# Altium project GTV11-Board.PrjPcb (part 4 of 4)

## Sheet Heater_Sheet.SchDoc
size A4
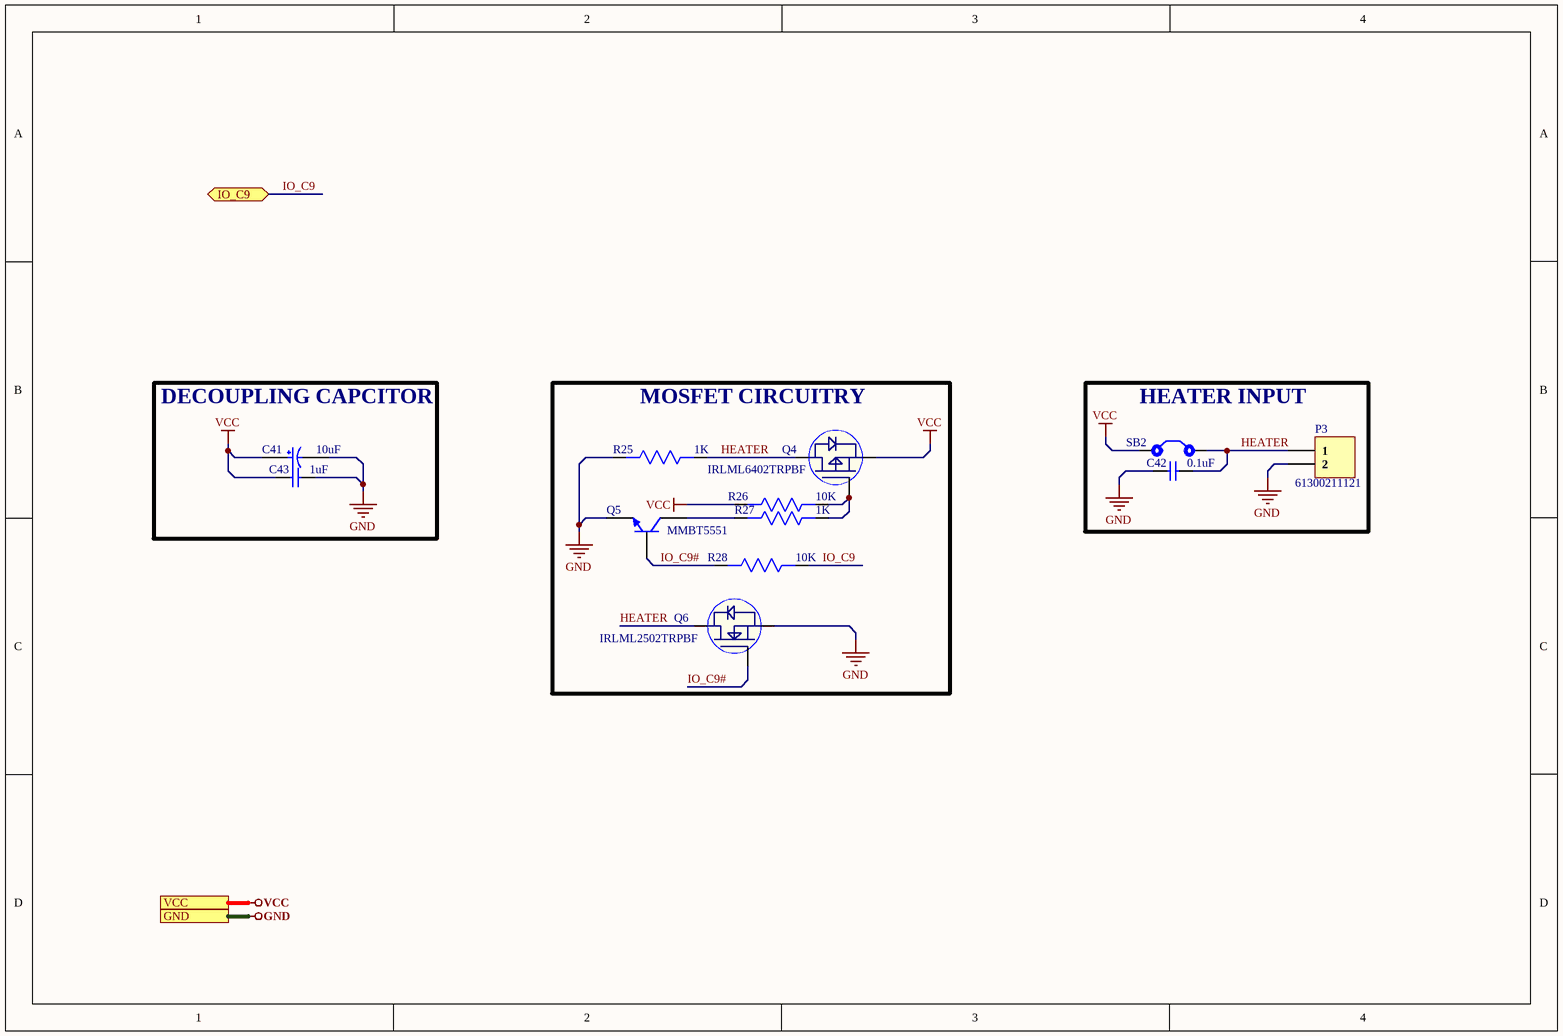
[diagram p10: Heater_Sheet.SchDoc]

### Parts
C41  10uF  [RVT1E100M0405.]
C42  0.1uF  [Cap0603]
C43  1uF  [Cap0603]
P3  61300211121  [HDR1X2]
Q4  IRLML6402TRPBF  [SOT-23]
Q5  MMBT5551  [SOT-23]
Q6  IRLML2502TRPBF  [SOT-23]
R25  1K  [RES-0603]
R26  10K  [RES-0603]
R27  1K  [RES-0603]
R28  10K  [RES-0603]
SB2  Solder Bridge  [Solder Bridge]  (value not drawn)

### Blocks framed on the sheet
DECOUPLING CAPCITOR: C41 C43
MOSFET CIRCUITRY: Q4-Q6 R25-R28
HEATER INPUT: C42 P3 SB2

### Ports
GND, IO_C9 (bidir), VCC

### Nets
GND: C41.2 C42.1 C43.2 P3.2 Q5.2(E) Q6.2(S) R25.2 ; port GND
VCC: C41.1 C43.1 Q4.2(S) R26.2 SB2.1 ; port VCC
HEATER: C42.2 P3.1 Q4.3(D) Q6.3(D) R25.1 SB2.2
IO_C9: R28.1 ; port IO_C9
IO_C9#: Q5.1(B) Q6.1(G) R28.2
NetQ4_1: Q4.1(G) R26.1 R27.1
NetQ5_3: Q5.3(C) R27.2

### Library data of the parts
C41 = RVT1E100M0405: CAP ALUM 10uF 25V SMD; Manufacturer: ROQANG; φD: 4mm; L: 5.4mm; Tolerance: ±20%; Operating Temperature: -45℃~+105℃; Rated Voltage: 25V; Capacitance: 10uF
C42 = CC0603ZRY5V9BB104: CAP CER 0.1UF 50V Y5V 0603; Manufacturer: Yageo; Capacitance: 100nF; Tolerance: 80%; Supplier 1: Digi-Key; Manufacturer Part Number: CC0603ZRY5V9BB104; Stock 1: 15000880; Pricing 1: 1=0.1, 10=0.075, 100=0.0334, 500=0.02386, 1000=0.01874 (USD); Mount: Surface Mount; Case/Package: 0603; Number of Pins: 2; Case Code (Metric): 1608; Case Code (Imperial): 0603; Min Operating Temperature: -30°C; Max Operating Temperature: 85°C; Dielectric: Y5V; Voltage Rating: 50V; Package Quantity: 1; Packaging: Tape and Reel; Voltage Rating (DC): 50V; Termination: SMD/SMT; Composition: Ceramic; Voltage: 50V; Length: 1.6mm; Height: 0.8mm; Width: 0.031inch; Thickness: 0.035inch; Depth: 0.8mm; Radiation Hardening: No; REACH SVHC: No SVHC; Lead Free: Lead Free; Halogen Free: Halogen Free; ComponentLink1URL: http://www.yageo.com/documents/recent/UPY-GPHC_Y5V_6.3V-to-50V_8.pdf?src-supplier=Digi-Key; ComponentLink1Description: http://www.yageo.com/documents/recent/UPY-GPHC_Y5V_6.3V-to-50V_8.pdf?src-supplier=Digi-Key; ComponentLink2URL: http://www.yageo.com/documents/recent/UPY-GPHC_Y5V_6.3V-to-50V_5.pdf?src-supplier=Avnet+Europe; ComponentLink2Description: http://www.yageo.com/documents/recent/UPY-GPHC_Y5V_6.3V-to-50V_5.pdf?src-supplier=Avnet+Europe; ComponentLink3URL: https://www.verical.com/server-webapp/html/getDatasheet?partID=403611&src-supplier=Verical; ComponentLink3Description: https://www.verical.com/server-webapp/html/getDatasheet?partID=403611&src-supplier=Verical; ComponentLink4URL: http://www.mouser.com/ds/2/447/Yageo_UPY-GP_NP0_16V-to-50V_9-358835.pdf?src-supplier=Mouser; ComponentLink4Description: http://www.mouser.com/ds/2/447/Yageo_UPY-GP_NP0_16V-to-50V_9-358835.pdf?src-supplier=Mouser; ComponentLink5URL: http://www.farnell.com/datasheets/1132289.pdf?src-supplier=Element14; ComponentLink5Description: http://www.farnell.com/datasheets/1132289.pdf?src-supplier=Element14; Supplier Part Number 1: 311-1343-1-ND
C43 = CC0603KRX5R8BB105: CAP CER 1UF 25V X5R 0603; Manufacturer: Yageo; Tolerance: 10%; Supplier 1: Digi-Key; Manufacturer Part Number: CC0603KRX5R8BB105; Stock 1: 1419041; Pricing 1: 1=0.1, 10=0.069, 100=0.0307, 500=0.0219, 1000=0.0172 (USD); Mount: Surface Mount; Case/Package: 0603; Number of Pins: 2; Case Code (Metric): 1608; Case Code (Imperial): 0603; Min Operating Temperature: -55°C; Max Operating Temperature: 85°C; Capacitance: 1uF; Dielectric: X5R; Package Quantity: 1; Voltage Rating: 25V; Packaging: Tape and Reel; Termination: SMD/SMT; Voltage Rating (DC): 25V; Length: 1.6mm; Height: 0.8mm; Width: 0.031inch; Thickness: 0.035inch; Depth: 0.8mm; Radiation Hardening: No; REACH SVHC: No SVHC; Lead Free: Lead Free; Halogen Free: Halogen Free; ComponentLink1URL: http://www.yageo.com/documents/recent/UPY-GPHC_X5R_4V-to-50V_25.pdf?src-supplier=Digi-Key; ComponentLink1Description: http://www.yageo.com/documents/recent/UPY-GPHC_X5R_4V-to-50V_25.pdf?src-supplier=Digi-Key; ComponentLink2URL: http://www.yageo.com/documents/recent/UPY-GPHC_X5R_4V-to-50V_12.pdf?src-supplier=Avnet+Europe; ComponentLink2Description: http://www.yageo.com/documents/recent/UPY-GPHC_X5R_4V-to-50V_12.pdf?src-supplier=Avnet+Europe; ComponentLink3URL: http://www.farnell.com/datasheets/1525783.pdf?src-supplier=Element14; ComponentLink3Description: http://www.farnell.com/datasheets/1525783.pdf?src-supplier=Element14; ComponentLink4URL: http://www.yageo.com/documents/recent/UPY-GPHC_X5R_4V-to-50V_12.pdf?src-supplier=Avnet; ComponentLink4Description: http://www.yageo.com/documents/recent/UPY-GPHC_X5R_4V-to-50V_12.pdf?src-supplier=Avnet; Supplier Part Number 1: 311-1445-6-ND
P3 = Header 1x2: CONN HEADER VERT 2POS 2.54MM; Manufacturer: Wurth Electronics; Current Rating: 3A; Voltage Rating: 250V; Number of Positions: 2; Gender: Male; Connector Type: Male Pin; Pitch: 0.1inch; Supplier 1: Digi-Key; Manufacturer Part Number: 61300211121; Stock 1: 219205; Pricing 1: 1=0.13, 10=0.106, 25=0.088, 50=0.074, 100=0.067, 1000=0.061 (USD); Mount: Through Hole; Contact Plating: Gold; Housing Material: PBT; Contact Material: Copper Alloy,Copper; Color: Black; Min Operating Temperature: -40°C; Max Operating Temperature: 125°C; Number of Rows: 1; Contact Gender: Male; Packaging: Bulk; Termination: Through Hole; Number of Contacts: 2; Contact Mating Length: 0.236inch; REACH SVHC: Unknown; Lead Free: Lead Free; ComponentLink1URL: http://www.mouser.com/ds/2/445/6130xx11121-538006.pdf?src-supplier=Mouser; ComponentLink1Description: http://www.mouser.com/ds/2/445/6130xx11121-538006.pdf?src-supplier=Mouser; Supplier Part Number 1: 732-5315-ND
Q4 = IRLML6402TRPBF: MOSFET P-CH 20V 3.7A SOT23; Manufacturer: International Rectifier; Rise Time: 48ns; Gate to Source Voltage (Vgs): 12V; Turn-On Delay Time: 350ns; Turn-Off Delay Time: 588ns; Fall Time: 381ns; Nominal Vgs: -550mV; Rds On Max: 65mR; Input Capacitance: 633pF; Max Power Dissipation: 1.3W; Number of Elements: 1; Dual Supply Voltage: -20V; Element Configuration: Single; Current Rating: -3.7A; Supplier 1: Newark; Manufacturer Part Number: IRLML6402TRPBF; RoHS: Yes; Category: MOSFETs; Mount: Surface Mount; Case/Package: SOT-23; Number of Pins: 3; Min Operating Temperature: -55°C; Max Operating Temperature: 150°C; Drain to Source Voltage (Vdss): 20V; Continuous Drain Current (ID): 3.7A; Package Quantity: 1; Packaging: Tape and Reel; Drain to Source Resistance: 65mR; Power Dissipation: 1.3W; Threshold Voltage: -550mV; Termination: SMD/SMT; Drain to Source Breakdown Voltage: -20V; Voltage Rating (DC): -20V; On-State Resistance: 65mR; Series: HEXFET®; Drain-source On Resistance-Max: 65mR; Length: 3.04mm; Width: 1.4mm; Height: 1.02mm; Radiation Hardening: No; Lead Free: Lead Free; RoHS Compliant: Yes; REACH SVHC: No SVHC; ComponentLink1URL: https://datasheet.ciiva.com/7799/13209-7799017.pdf?src-supplier=Element14; ComponentLink1Description: https://datasheet.ciiva.com/7799/13209-7799017.pdf?src-supplier=Element14; ComponentLink2URL: https://datasheet.ciiva.com/34302/1563729-34302500.pdf?src-supplier=Jameco; ComponentLink2Description: https://datasheet.ciiva.com/34302/1563729-34302500.pdf?src-supplier=Jameco; ComponentLink3URL: https://datasheet.ciiva.com/28515/irlml6402pbf-28515795.pdf?src-supplier=Element14; ComponentLink3Description: https://datasheet.ciiva.com/28515/irlml6402pbf-28515795.pdf?src-supplier=Element14; ComponentLink4URL: https://datasheet.ciiva.com/7333/irlml6402-7333200.pdf?src-supplier=Newark; ComponentLink4Description: https://datasheet.ciiva.com/7333/irlml6402-7333200.pdf?src-supplier=Newark; ComponentLink5URL: https://datasheet.ciiva.com/29326/162833-da-01-en-irlml-6402tr-29326798.pdf?src-supplier=Conrad; ComponentLink5Description: https://datasheet.ciiva.com/29326/162833-da-01-en-irlml-6402tr-29326798.pdf?src-supplier=Conrad; ComponentLink6URL: https://datasheet.ciiva.com/7799/13209-7799018.pdf?src-supplier=Element14; ComponentLink6Description: https://datasheet.ciiva.com/7799/13209-7799018.pdf?src-supplier=Element14; ComponentLink7URL: https://datasheet.ciiva.com/936/irlml6402pbf-936987.pdf?src-supplier=Digi-Key; ComponentLink7Description: https://datasheet.ciiva.com/936/irlml6402pbf-936987.pdf?src-supplier=Digi-Key; ComponentLink8URL: https://datasheet.ciiva.com/936/irlml6402pbf-936988.pdf?src-supplier=Digi-Key; ComponentLink8Description: https://datasheet.ciiva.com/936/irlml6402pbf-936988.pdf?src-supplier=Digi-Key; ComponentLink9URL: https://datasheet.ciiva.com/16311/irlml6402pbf-16311535.pdf?src-supplier=Future+Electronics; ComponentLink9Description: https://datasheet.ciiva.com/16311/irlml6402pbf-16311535.pdf?src-supplier=Future+Electronics; Supplier Part Number 1: 06X2796
Q5 = MMBT5551: TRANS NPN 160V 0.6A SOT-23; Manufacturer: ON Semiconductor; Manufacturer Part Number: MMBT5551LT1G; Max Power Dissipation: 225mW; Max Collector Current: 600mA; Collector Base Voltage (VCBO): 180V; Emitter Base Voltage (VEBO): 6V; Element Configuration: Single; hFE Min: 80; Power Dissipation: 300mW; Number of Elements: 1; Collector Emitter Saturation Voltage: 150mV; Collector-emitter Voltage-Max: 200mV; Supplier 1: Digi-Key; RoHS: Yes; Category: BJTs; Pricing 1: 1=0.22000, 10=0.17700, 100=0.09370, 500=0.06162, 1000=0.04190 (USD); Case/Package: SOT-23-3; Number of Pins: 3; Weight: 0.01lb; Contact Plating: Tin,Matte; Min Operating Temperature: -55°C; Max Operating Temperature: 150°C; Packaging: Tape and Reel; Collector Emitter Voltage (VCEO): 160V; Polarity: NPN; Package Quantity: 1; Collector Emitter Breakdown Voltage: 160V; Current Rating: 600mA; Voltage Rating (DC): 160V; Max Breakdown Voltage: 160V; Series: -; Length: 2.9mm; Width: 1.3mm; Height: 0.94mm; Radiation Hardening: No; Lead Free: Lead Free; REACH SVHC: No SVHC; RoHS Compliant: Yes; ComponentLink1URL: https://datasheet.ciiva.com/976/mmbt5550lt1-d-976512.pdf?src-supplier=Digi-Key; ComponentLink1Description: https://datasheet.ciiva.com/976/mmbt5550lt1-d-976512.pdf?src-supplier=Digi-Key; ComponentLink2URL: https://datasheet.ciiva.com/34303/2011387-34303825.pdf?src-supplier=Jameco; ComponentLink2Description: https://datasheet.ciiva.com/34303/2011387-34303825.pdf?src-supplier=Jameco; ComponentLink3URL: https://datasheet.ciiva.com/15139/getdatasheetpartid-92641-15139178.pdf?src-supplier=Verical; ComponentLink3Description: https://datasheet.ciiva.com/15139/getdatasheetpartid-92641-15139178.pdf?src-supplier=Verical; ComponentLink4URL: https://datasheet.ciiva.com/16984/0900766b8078eb1b-16984971.pdf?src-supplier=Allied+Electronics; ComponentLink4Description: https://datasheet.ciiva.com/16984/0900766b8078eb1b-16984971.pdf?src-supplier=Allied+Electronics; ComponentLink5URL: https://datasheet.ciiva.com/976/mmbt5550lt1-d-976513.pdf?src-supplier=Digi-Key; ComponentLink5Description: https://datasheet.ciiva.com/976/mmbt5550lt1-d-976513.pdf?src-supplier=Digi-Key; ComponentLink6URL: https://datasheet.ciiva.com/4722/mmbt5550lt1-d-111393-4722711.pdf?src-supplier=Mouser; ComponentLink6Description: https://datasheet.ciiva.com/4722/mmbt5550lt1-d-111393-4722711.pdf?src-supplier=Mouser; ComponentLink7URL: https://datasheet.ciiva.com/16478/mmbt5550lt1-d-16478568.pdf?src-supplier=Avnet+Asia; ComponentLink7Description: https://datasheet.ciiva.com/16478/mmbt5550lt1-d-16478568.pdf?src-supplier=Avnet+Asia; ComponentLink8URL: https://datasheet.ciiva.com/7972/mmbt5550lt1-d-7972073.pdf?src-supplier=Element14; ComponentLink8Description: https://datasheet.ciiva.com/7972/mmbt5550lt1-d-7972073.pdf?src-supplier=Element14; ComponentLink9URL: https://datasheet.ciiva.com/25997/mmbt5550lt1-d-25997449.pdf?src-supplier=Avnet+Europe; ComponentLink9Description: https://datasheet.ciiva.com/25997/mmbt5550lt1-d-25997449.pdf?src-supplier=Avnet+Europe; ComponentLink10URL: https://datasheet.ciiva.com/7972/mmbt5550lt1-d-7972075.pdf?src-supplier=Element14; ComponentLink10Description: https://datasheet.ciiva.com/7972/mmbt5550lt1-d-7972075.pdf?src-supplier=Element14; ComponentLink11URL: https://datasheet.ciiva.com/11197/mmbt5550lt1-d-11197404.pdf?src-supplier=Avnet; ComponentLink11Description: https://datasheet.ciiva.com/11197/mmbt5550lt1-d-11197404.pdf?src-supplier=Avnet; ComponentLink12URL: https://datasheet.ciiva.com/976/mmbt5550lt1-d-976511.pdf?src-supplier=Digi-Key; ComponentLink12Description: https://datasheet.ciiva.com/976/mmbt5550lt1-d-976511.pdf?src-supplier=Digi-Key; ComponentLink13URL: https://datasheet.ciiva.com/16342/mmbt5550lt1-d-16342687.pdf?src-supplier=Future+Electronics; ComponentLink13Description: https://datasheet.ciiva.com/16342/mmbt5550lt1-d-16342687.pdf?src-supplier=Future+Electronics; Supplier Part Number 1: MMBT5551LT1GOSDKR-ND
Q6 = IRLML2502TRPBF: MOSFET N-CH 20V 4.2A SOT23; Manufacturer: International Rectifier; Rise Time: 10ns; Max Power Dissipation: 1.25W; Gate to Source Voltage (Vgs): 12V; Turn-On Delay Time: 7.5ns; Turn-Off Delay Time: 54ns; Fall Time: 26ns; Threshold Voltage: 1.2V; Rds On Max: 45mR; Input Capacitance: 740pF; Number of Elements: 1; Element Configuration: Single; Supplier 1: Newark; Manufacturer Part Number: IRLML2502TRPBF; RoHS: Yes; Category: MOSFETs; Mount: Surface Mount; Case/Package: SOT-23; Number of Pins: 3; Min Operating Temperature: -55°C; Max Operating Temperature: 150°C; Continuous Drain Current (ID): 4.2A; Drain to Source Voltage (Vdss): 20V; Packaging: Tape and Reel; Package Quantity: 3000; Nominal Vgs: 1.2V; Dual Supply Voltage: 20V; Drain to Source Breakdown Voltage: 20V; Drain to Source Resistance: 45mR; Power Dissipation: 1.25W; Termination: SMD/SMT; Voltage Rating (DC): 20V; Current Rating: 4.2A; On-State Resistance: 45mR; Drain-source On Resistance-Max: 45mR; Length: 2.8mm; Width: 1.4mm; Height: 1.02mm; Radiation Hardening: No; REACH SVHC: No SVHC; Lead Free: Lead Free; ComponentLink1URL: https://datasheet.ciiva.com/36526/1563649-36526014.pdf?src-supplier=Jameco; ComponentLink1Description: https://datasheet.ciiva.com/36526/1563649-36526014.pdf?src-supplier=Jameco; ComponentLink2URL: https://datasheet.ciiva.com/16425/irlml2502pbf-16425943.pdf?src-supplier=Future+Electronics; ComponentLink2Description: https://datasheet.ciiva.com/16425/irlml2502pbf-16425943.pdf?src-supplier=Future+Electronics; ComponentLink3URL: https://datasheet.ciiva.com/6156/irlml2502-6156070.pdf?src-supplier=Farnell; ComponentLink3Description: https://datasheet.ciiva.com/6156/irlml2502-6156070.pdf?src-supplier=Farnell; ComponentLink4URL: https://datasheet.ciiva.com/7935/irlml2502-7935685.pdf?src-supplier=Element14; ComponentLink4Description: https://datasheet.ciiva.com/7935/irlml2502-7935685.pdf?src-supplier=Element14; Supplier Part Number 1: 11X6741
R25 R27 = RC0603FR-071KL: RES SMD 1K OHM 1% 1/10W 0603; Manufacturer: Yageo; Resistance: 1kR; Temperature Coefficient: 100ppm/°C; Power Rating: 100mW; Voltage Rating: 50V; ComponentLink1URL: https://www.verical.com/server-webapp/html/getDatasheet?partID=409289&src-supplier=Verical; ComponentLink1Description: https://www.verical.com/server-webapp/html/getDatasheet?partID=409289&src-supplier=Verical; Supplier 1: Digi-Key; Manufacturer Part Number: RC0603FR-071KL; Stock 1: 21472395; Pricing 1: 1=0.1, 10=0.023, 100=0.0094, 1000=0.0042, 2500=0.0037 (USD); Case/Package: 0603; Contact Plating: Tin,Matte; Case Code (Imperial): 0603; Case Code (Metric): 1608; Min Operating Temperature: -55°C; Max Operating Temperature: 155°C; Tolerance: 1%; Composition: Thick Film; Packaging: Tape and Reel; Termination: SMD/SMT; Military Standard: Not; Length: 1.6mm; Height: 0.45mm; Depth: 0.8mm; Radiation Hardening: No; REACH SVHC: No SVHC; Lead Free: Lead Free; ComponentLink2URL: http://documents.rs-components.com/techlib://itc_doclist_GB.htm?stockno=5048928&src-supplier=RSComponents; ComponentLink2Description: http://documents.rs-components.com/techlib://itc_doclist_GB.htm?stockno=5048928&src-supplier=RSComponents; ComponentLink3URL: http://www.yageo.com/documents/recent/PYu-RC0603_51_RoHS_L_4.pdf?src-supplier=Avnet+Europe; ComponentLink3Description: http://www.yageo.com/documents/recent/PYu-RC0603_51_RoHS_L_4.pdf?src-supplier=Avnet+Europe; ComponentLink4URL: http://www.farnell.com/datasheets/2167052.pdf?src-supplier=Element14; ComponentLink4Description: http://www.farnell.com/datasheets/2167052.pdf?src-supplier=Element14; ComponentLink5URL: http://www.farnell.com/datasheets/1868787.pdf?src-supplier=Element14; ComponentLink5Description: http://www.farnell.com/datasheets/1868787.pdf?src-supplier=Element14; ComponentLink6URL: http://www.yageo.com/documents/recent/PYu-RC_Group_51_RoHS_L_2.pdf?src-supplier=Avnet; ComponentLink6Description: http://www.yageo.com/documents/recent/PYu-RC_Group_51_RoHS_L_2.pdf?src-supplier=Avnet; ComponentLink7URL: https://www.verical.com/server-webapp/html/getDatasheet?partID=404327&src-supplier=Verical; ComponentLink7Description: https://www.verical.com/server-webapp/html/getDatasheet?partID=404327&src-supplier=Verical; ComponentLink8URL: http://www.farnell.com/datasheets/443971.pdf?src-supplier=Element14; ComponentLink8Description: http://www.farnell.com/datasheets/443971.pdf?src-supplier=Element14; Supplier Part Number 1: 311-1.00KHRDKR-ND
R26 R28 = AC0603JR-0710KL: RES SMD 10K OHM 5% 1/10W 0603; Manufacturer: Yageo; Voltage Rating: 50V; Resistance: 10kR; Power Rating: 100mW; Temperature Coefficient: 100ppm/°C; Supplier 1: Future Electronics; Manufacturer Part Number: AC0603JR-0710KL; RoHS: Yes; Category: Chip SMD Resistors; Stock 1: 1533000; Pricing 1: 5000=0.00540 (USD); Case/Package: 0603; Case Code (Imperial): 0603; Case Code (Metric): 1608; Size Code: 0603; Min Operating Temperature: -55°C; Max Operating Temperature: 155°C; Packaging: Tape and Reel; Tolerance: 5%; Package Quantity: 1; Resistor Type: Thick Film; Termination: SMD/SMT; Number of Terminations: 2; Max Power Dissipation: 100mW; Features: Moisture Resistant,Automotive AEC-Q200,Anti-Sulfur; Series: AC; Construction: Rectangular; Length: 0.063inch; Width: 0.031inch; Height: 0.022inch; Depth: 0.8mm; Military Standard: Not; Lead Free: Lead Free; RoHS Compliant: Yes; ComponentLink1URL: https://datasheet.ciiva.com/5562/pyu-ac-51-rohs-l-2-5562553.pdf?src-supplier=Mouser; ComponentLink1Description: https://datasheet.ciiva.com/5562/pyu-ac-51-rohs-l-2-5562553.pdf?src-supplier=Mouser; Supplier Part Number 1: 1029044
SB2 = Solder Bridge: Solder Bridge ON

## Sheet Temperature_Sensor_Section.SchDoc
size A4
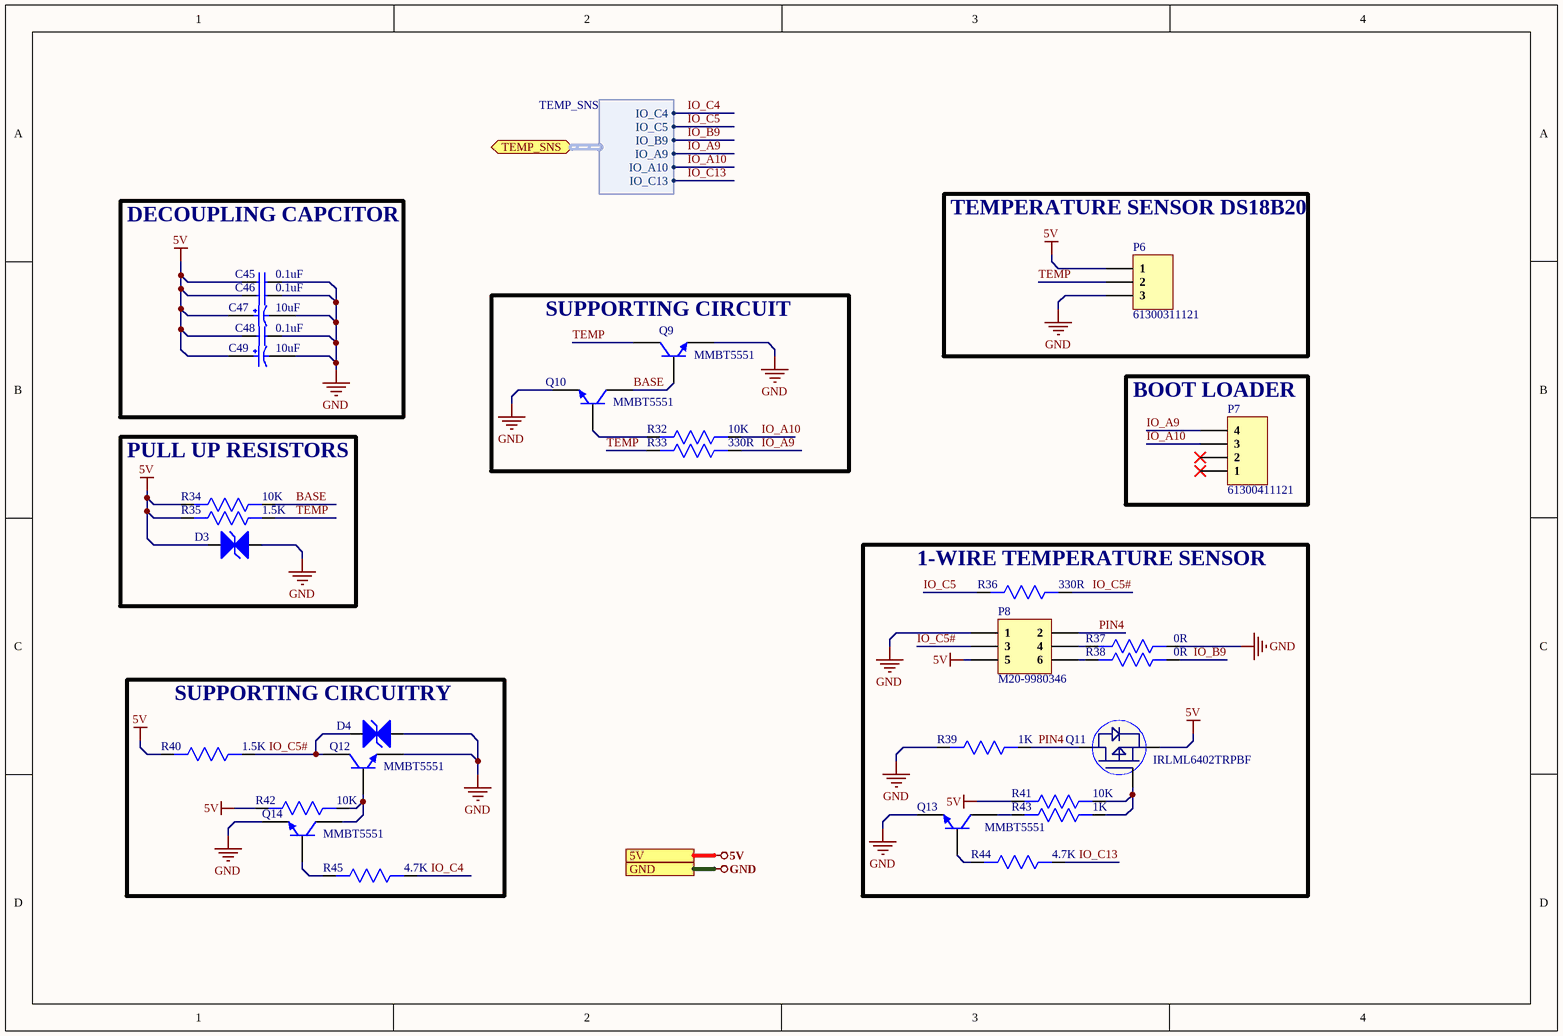
[diagram p11: Temperature_Sensor_Section.SchDoc]

### Parts
C45  0.1uF  [Cap0603]
C46  0.1uF  [Cap0603]
C47  10uF  [RVT1E100M0405.]
C48  0.1uF  [Cap0603]
C49  10uF  [RVT1E100M0405.]
D3  SMAJ5.0CA  [SMAJ5.0CA]  (value not drawn)
D4  SMAJ5.0CA  [SMAJ5.0CA]  (value not drawn)
P6  61300311121  [HDR1X3]
P7  61300411121  [HDR1X4]
P8  M20-9980346  [HDR2X3]
Q9  MMBT5551  [SOT-23]
Q10  MMBT5551  [SOT-23]
Q11  IRLML6402TRPBF  [SOT-23]
Q12  MMBT5551  [SOT-23]
Q13  MMBT5551  [SOT-23]
Q14  MMBT5551  [SOT-23]
R32  10K  [RES-0603]
R33  330R  [RES-0603]
R34  10K  [RES-0603]
R35  1.5K  [RES-0603]
R36  330R  [RES-0603]
R37  0R  [RES-0603]
R38  0R  [RES-0603]
R39  1K  [RES-0603]
R40  1.5K  [RES-0603]
R41  10K  [RES-0603]
R42  10K  [RES-0603]
R43  1K  [RES-0603]
R44  4.7K  [RES-0603]
R45  4.7K  [RES-0603]

### Blocks framed on the sheet
TEMPERATURE SENSOR DS18B20: P6
DECOUPLING CAPCITOR: C45-C49
SUPPORTING CIRCUIT: Q9 Q10 R32 R33
BOOT LOADER: P7
PULL UP RESISTORS: D3 R34 R35
1-WIRE TEMPERATURE SENSOR: P8 Q11 Q13 R36-R39 R41 R43 R44
SUPPORTING CIRCUITRY: D4 Q12 Q14 R40 R42 R45

### Ports
5V, GND, TEMP_SNS (bidir, harness TEMP_SNS)

### Harnesses
TEMP_SNS: IO_C4, IO_C5, IO_B9, IO_A9, IO_A10, IO_C13

### Nets
5V: C45.1 C46.1 C47.1 C48.1 C49.1 D3.2(A) P6.1 P8.5 Q11.2(S) R34.2 R35.2 R40.2 R41.2 R42.2 ; port 5V
GND: C45.2 C46.2 C47.2 C48.2 C49.2 D3.1(K) D4.1(K) P6.3 P8.1 Q9.2(E) Q10.2(E) Q12.2(E) Q13.2(E) Q14.2(E) R37.1 R39.2 ; port GND
BASE: Q9.1(B) Q10.3(C) R34.1
IO_A9: P7.4 R33.1 ; port TEMP_SNS.IO_A9
IO_A10: P7.3 R32.1 ; port TEMP_SNS.IO_A10
IO_B9: R38.1 ; port TEMP_SNS.IO_B9
IO_C4: R45.1 ; port TEMP_SNS.IO_C4
IO_C5: R36.2 ; port TEMP_SNS.IO_C5
IO_C5#: D4.2(A) P8.3 Q12.3(C) R36.1 R40.1
IO_C13: R44.1 ; port TEMP_SNS.IO_C13
PIN4: P8.2 Q11.3(D) R39.1
TEMP: P6.2 Q9.3(C) R33.2 R35.1
NetP8_4: P8.4 R37.2
NetP8_6: P8.6 R38.2
NetQ10_1: Q10.1(B) R32.2
NetQ11_1: Q11.1(G) R41.1 R43.1
NetQ12_1: Q12.1(B) Q14.3(C) R42.1
NetQ13_1: Q13.1(B) R44.2
NetQ13_3: Q13.3(C) R43.2
NetQ14_1: Q14.1(B) R45.2

Not connected (* = marked no-connect by the designer): P7 1* 2*

### Library data of the parts
C45 C46 C48 = CC0603ZRY5V9BB104: as C42 on sheet Heater_Sheet; Supplier 1: Digi-Key; Manufacturer Part Number: CC0603ZRY5V9BB104; Stock 1: 15000880; Pricing 1: 1=0.1, 10=0.075, 100=0.0334, 500=0.02386, 1000=0.01874 (USD); Mount: Surface Mount; Case/Package: 0603; Number of Pins: 2; Case Code (Metric): 1608; Case Code (Imperial): 0603; Min Operating Temperature: -30°C; Max Operating Temperature: 85°C; Dielectric: Y5V; Voltage Rating: 50V; Package Quantity: 1; Packaging: Tape and Reel; Voltage Rating (DC): 50V; Termination: SMD/SMT; Composition: Ceramic; Voltage: 50V; Length: 1.6mm; Height: 0.8mm; Width: 0.031inch; Thickness: 0.035inch; Depth: 0.8mm; Radiation Hardening: No; REACH SVHC: No SVHC; Lead Free: Lead Free; Halogen Free: Halogen Free; ComponentLink1URL: http://www.yageo.com/documents/recent/UPY-GPHC_Y5V_6.3V-to-50V_8.pdf?src-supplier=Digi-Key; ComponentLink1Description: http://www.yageo.com/documents/recent/UPY-GPHC_Y5V_6.3V-to-50V_8.pdf?src-supplier=Digi-Key; ComponentLink2URL: http://www.yageo.com/documents/recent/UPY-GPHC_Y5V_6.3V-to-50V_5.pdf?src-supplier=Avnet+Europe; ComponentLink2Description: http://www.yageo.com/documents/recent/UPY-GPHC_Y5V_6.3V-to-50V_5.pdf?src-supplier=Avnet+Europe; ComponentLink3URL: https://www.verical.com/server-webapp/html/getDatasheet?partID=403611&src-supplier=Verical; ComponentLink3Description: https://www.verical.com/server-webapp/html/getDatasheet?partID=403611&src-supplier=Verical; ComponentLink4URL: http://www.mouser.com/ds/2/447/Yageo_UPY-GP_NP0_16V-to-50V_9-358835.pdf?src-supplier=Mouser; ComponentLink4Description: http://www.mouser.com/ds/2/447/Yageo_UPY-GP_NP0_16V-to-50V_9-358835.pdf?src-supplier=Mouser; ComponentLink5URL: http://www.farnell.com/datasheets/1132289.pdf?src-supplier=Element14; ComponentLink5Description: http://www.farnell.com/datasheets/1132289.pdf?src-supplier=Element14; Supplier Part Number 1: 311-1343-1-ND
C47 C49 = RVT1E100M0405: as C41 on sheet Heater_Sheet; Operating Temperature: -45℃~+105℃; Rated Voltage: 25V; Capacitance: 10uF
D3 D4 = SMAJ5.0CA: 800uA 43.5A 9.2V 6.4V 5V 7V Bi-Directional SMA TVS ROHS; Manufacturer: Shandong Jingdao Microelectronics; ComponentLink1Description: LCSC; ComponentLink1URL: https://lcsc.com/product-detail/TVS_Shandong-Jingdao-Microelectronics-SMAJ5-0CA_C353441.html; Manufacturer Part Number: SMAJ5.0CA; Footprint: SMA
P6 = Header 1X3: CONN HEADER VERT 3POS 2.54MM; Manufacturer: Wurth Electronics; Number of Positions: 3; Gender: Male; Connector Type: Male Pin; Pitch: 0.1inch; Supplier 1: Digi-Key; Manufacturer Part Number: 61300311121; Stock 1: 81286; Pricing 1: 1=0.13, 10=0.106, 25=0.088, 50=0.074, 100=0.067, 1000=0.061 (USD); Mount: Through Hole; Contact Plating: Gold; Contact Material: Copper; Color: Black; Number of Rows: 1; Packaging: Bulk; Termination: Solder; Number of Contacts: 3; Contact Mating Length: 0.236inch; REACH SVHC: Unknown; Lead Free: Lead Free; ComponentLink1URL: http://www.farnell.com/cad/1737268.pdf?src-supplier=Element14; ComponentLink1Description: http://www.farnell.com/cad/1737268.pdf?src-supplier=Element14; ComponentLink2URL: https://katalog.we-online.de/em/datasheet/6130xx11121.pdf?src-supplier=Digi-Key; ComponentLink2Description: https://katalog.we-online.de/em/datasheet/6130xx11121.pdf?src-supplier=Digi-Key; Supplier Part Number 1: 732-5316-ND
P7 = Header 1x4: CONN HEADER VERT 4POS 2.54MM; Manufacturer: Wurth Electronics; Number of Positions: 4; Gender: Male; Connector Type: Male Pin; Pitch: 0.1inch; Supplier 1: Digi-Key; Manufacturer Part Number: 61300411121; Stock 1: 20544; Pricing 1: 1=0.18, 10=0.153, 25=0.1272, 50=0.106, 100=0.096, 1000=0.088 (USD); Mount: Through Hole; Contact Plating: Gold; Contact Material: Copper; Color: Black; Number of Rows: 1; Packaging: Bulk; Termination: Solder; Number of Contacts: 4; Contact Mating Length: 0.236inch; REACH SVHC: Unknown; Lead Free: Lead Free; ComponentLink1URL: http://www.farnell.com/cad/1737268.pdf?src-supplier=Element14; ComponentLink1Description: http://www.farnell.com/cad/1737268.pdf?src-supplier=Element14; ComponentLink2URL: https://katalog.we-online.de/em/datasheet/6130xx11121.pdf?src-supplier=Digi-Key; ComponentLink2Description: https://katalog.we-online.de/em/datasheet/6130xx11121.pdf?src-supplier=Digi-Key; Supplier Part Number 1: 732-5317-ND
P8 = Header 2x3: CONN HEADER VERT 6POS 2.54MM; Manufacturer: Harwin; Number of Contacts: 6; Contact Resistance: 25mR; Current Rating: 3A; Gender: Male; Insulation Resistance: 10GR; Connector Type: Male Pin; Row Spacing: 0.1inch; Supplier 1: Digi-Key; Manufacturer Part Number: M20-9980346; Stock 1: 19517; Pricing 1: 1=0.24, 10=0.229, 100=0.1586, 500=0.1342, 1000=0.1098, 5000=0.0976, 10000=0.08845 (USD); Mount: Through Hole; Contact Plating: Tin; Color: Black; Contact Material: Bronze,Brass; Housing Color: Black; Housing Material: Nylon; Min Operating Temperature: -40°C; Max Operating Temperature: 105°C; Number of Rows: 2; Termination: Solder; Package Quantity: 1000; Packaging: Bag; Max Current Rating: 3A; Number of Positions: 6; Orientation: Straight; Length: 7.62mm; Pitch: 2.54mm; Contact Mating Length: 0.24inch; Depth: 5.08mm; Radiation Hardening: No; REACH SVHC: No SVHC; ComponentLink1URL: http://uk.rs-online.com/webdocs/1406/0900766b81406898.pdf?src-supplier=RSComponents; ComponentLink1Description: http://uk.rs-online.com/webdocs/1406/0900766b81406898.pdf?src-supplier=RSComponents; ComponentLink2URL: https://www.verical.com/server-webapp/html/getDatasheet?partID=483857&src-supplier=Verical; ComponentLink2Description: https://www.verical.com/server-webapp/html/getDatasheet?partID=483857&src-supplier=Verical; ComponentLink3URL: http://www.farnell.com/datasheets/2368211.pdf?src-supplier=Element14; ComponentLink3Description: http://www.farnell.com/datasheets/2368211.pdf?src-supplier=Element14; Supplier Part Number 1: 952-2121-ND
Q9 Q10 Q12-Q14 = MMBT5551: as Q5 on sheet Heater_Sheet; Supplier 1: Digi-Key; RoHS: Yes; Category: BJTs; Pricing 1: 1=0.22000, 10=0.17700, 100=0.09370, 500=0.06162, 1000=0.04190 (USD); Case/Package: SOT-23-3; Number of Pins: 3; Weight: 0.01lb; Contact Plating: Tin,Matte; Min Operating Temperature: -55°C; Max Operating Temperature: 150°C; Packaging: Tape and Reel; Collector Emitter Voltage (VCEO): 160V; Polarity: NPN; Package Quantity: 1; Collector Emitter Breakdown Voltage: 160V; Current Rating: 600mA; Voltage Rating (DC): 160V; Max Breakdown Voltage: 160V; Series: -; Length: 2.9mm; Width: 1.3mm; Height: 0.94mm; Radiation Hardening: No; Lead Free: Lead Free; REACH SVHC: No SVHC; RoHS Compliant: Yes; ComponentLink1URL: https://datasheet.ciiva.com/976/mmbt5550lt1-d-976512.pdf?src-supplier=Digi-Key; ComponentLink1Description: https://datasheet.ciiva.com/976/mmbt5550lt1-d-976512.pdf?src-supplier=Digi-Key; ComponentLink2URL: https://datasheet.ciiva.com/34303/2011387-34303825.pdf?src-supplier=Jameco; ComponentLink2Description: https://datasheet.ciiva.com/34303/2011387-34303825.pdf?src-supplier=Jameco; ComponentLink3URL: https://datasheet.ciiva.com/15139/getdatasheetpartid-92641-15139178.pdf?src-supplier=Verical; ComponentLink3Description: https://datasheet.ciiva.com/15139/getdatasheetpartid-92641-15139178.pdf?src-supplier=Verical; ComponentLink4URL: https://datasheet.ciiva.com/16984/0900766b8078eb1b-16984971.pdf?src-supplier=Allied+Electronics; ComponentLink4Description: https://datasheet.ciiva.com/16984/0900766b8078eb1b-16984971.pdf?src-supplier=Allied+Electronics; ComponentLink5URL: https://datasheet.ciiva.com/976/mmbt5550lt1-d-976513.pdf?src-supplier=Digi-Key; ComponentLink5Description: https://datasheet.ciiva.com/976/mmbt5550lt1-d-976513.pdf?src-supplier=Digi-Key; ComponentLink6URL: https://datasheet.ciiva.com/4722/mmbt5550lt1-d-111393-4722711.pdf?src-supplier=Mouser; ComponentLink6Description: https://datasheet.ciiva.com/4722/mmbt5550lt1-d-111393-4722711.pdf?src-supplier=Mouser; ComponentLink7URL: https://datasheet.ciiva.com/16478/mmbt5550lt1-d-16478568.pdf?src-supplier=Avnet+Asia; ComponentLink7Description: https://datasheet.ciiva.com/16478/mmbt5550lt1-d-16478568.pdf?src-supplier=Avnet+Asia; ComponentLink8URL: https://datasheet.ciiva.com/7972/mmbt5550lt1-d-7972073.pdf?src-supplier=Element14; ComponentLink8Description: https://datasheet.ciiva.com/7972/mmbt5550lt1-d-7972073.pdf?src-supplier=Element14; ComponentLink9URL: https://datasheet.ciiva.com/25997/mmbt5550lt1-d-25997449.pdf?src-supplier=Avnet+Europe; ComponentLink9Description: https://datasheet.ciiva.com/25997/mmbt5550lt1-d-25997449.pdf?src-supplier=Avnet+Europe; ComponentLink10URL: https://datasheet.ciiva.com/7972/mmbt5550lt1-d-7972075.pdf?src-supplier=Element14; ComponentLink10Description: https://datasheet.ciiva.com/7972/mmbt5550lt1-d-7972075.pdf?src-supplier=Element14; ComponentLink11URL: https://datasheet.ciiva.com/11197/mmbt5550lt1-d-11197404.pdf?src-supplier=Avnet; ComponentLink11Description: https://datasheet.ciiva.com/11197/mmbt5550lt1-d-11197404.pdf?src-supplier=Avnet; ComponentLink12URL: https://datasheet.ciiva.com/976/mmbt5550lt1-d-976511.pdf?src-supplier=Digi-Key; ComponentLink12Description: https://datasheet.ciiva.com/976/mmbt5550lt1-d-976511.pdf?src-supplier=Digi-Key; ComponentLink13URL: https://datasheet.ciiva.com/16342/mmbt5550lt1-d-16342687.pdf?src-supplier=Future+Electronics; ComponentLink13Description: https://datasheet.ciiva.com/16342/mmbt5550lt1-d-16342687.pdf?src-supplier=Future+Electronics; Supplier Part Number 1: MMBT5551LT1GOSDKR-ND
Q11 = IRLML6402TRPBF: as Q4 on sheet Heater_Sheet; Supplier 1: Newark; Manufacturer Part Number: IRLML6402TRPBF; RoHS: Yes; Category: MOSFETs; Mount: Surface Mount; Case/Package: SOT-23; Number of Pins: 3; Min Operating Temperature: -55°C; Max Operating Temperature: 150°C; Drain to Source Voltage (Vdss): 20V; Continuous Drain Current (ID): 3.7A; Package Quantity: 1; Packaging: Tape and Reel; Drain to Source Resistance: 65mR; Power Dissipation: 1.3W; Threshold Voltage: -550mV; Termination: SMD/SMT; Drain to Source Breakdown Voltage: -20V; Voltage Rating (DC): -20V; On-State Resistance: 65mR; Series: HEXFET®; Drain-source On Resistance-Max: 65mR; Length: 3.04mm; Width: 1.4mm; Height: 1.02mm; Radiation Hardening: No; Lead Free: Lead Free; RoHS Compliant: Yes; REACH SVHC: No SVHC; ComponentLink1URL: https://datasheet.ciiva.com/7799/13209-7799017.pdf?src-supplier=Element14; ComponentLink1Description: https://datasheet.ciiva.com/7799/13209-7799017.pdf?src-supplier=Element14; ComponentLink2URL: https://datasheet.ciiva.com/34302/1563729-34302500.pdf?src-supplier=Jameco; ComponentLink2Description: https://datasheet.ciiva.com/34302/1563729-34302500.pdf?src-supplier=Jameco; ComponentLink3URL: https://datasheet.ciiva.com/28515/irlml6402pbf-28515795.pdf?src-supplier=Element14; ComponentLink3Description: https://datasheet.ciiva.com/28515/irlml6402pbf-28515795.pdf?src-supplier=Element14; ComponentLink4URL: https://datasheet.ciiva.com/7333/irlml6402-7333200.pdf?src-supplier=Newark; ComponentLink4Description: https://datasheet.ciiva.com/7333/irlml6402-7333200.pdf?src-supplier=Newark; ComponentLink5URL: https://datasheet.ciiva.com/29326/162833-da-01-en-irlml-6402tr-29326798.pdf?src-supplier=Conrad; ComponentLink5Description: https://datasheet.ciiva.com/29326/162833-da-01-en-irlml-6402tr-29326798.pdf?src-supplier=Conrad; ComponentLink6URL: https://datasheet.ciiva.com/7799/13209-7799018.pdf?src-supplier=Element14; ComponentLink6Description: https://datasheet.ciiva.com/7799/13209-7799018.pdf?src-supplier=Element14; ComponentLink7URL: https://datasheet.ciiva.com/936/irlml6402pbf-936987.pdf?src-supplier=Digi-Key; ComponentLink7Description: https://datasheet.ciiva.com/936/irlml6402pbf-936987.pdf?src-supplier=Digi-Key; ComponentLink8URL: https://datasheet.ciiva.com/936/irlml6402pbf-936988.pdf?src-supplier=Digi-Key; ComponentLink8Description: https://datasheet.ciiva.com/936/irlml6402pbf-936988.pdf?src-supplier=Digi-Key; ComponentLink9URL: https://datasheet.ciiva.com/16311/irlml6402pbf-16311535.pdf?src-supplier=Future+Electronics; ComponentLink9Description: https://datasheet.ciiva.com/16311/irlml6402pbf-16311535.pdf?src-supplier=Future+Electronics; Supplier Part Number 1: 06X2796
R32 R34 R41 R42 = AC0603JR-0710KL: as R26 on sheet Heater_Sheet; Supplier 1: Future Electronics; Manufacturer Part Number: AC0603JR-0710KL; RoHS: Yes; Category: Chip SMD Resistors; Stock 1: 1533000; Pricing 1: 5000=0.00540 (USD); Case/Package: 0603; Case Code (Imperial): 0603; Case Code (Metric): 1608; Size Code: 0603; Min Operating Temperature: -55°C; Max Operating Temperature: 155°C; Packaging: Tape and Reel; Tolerance: 5%; Package Quantity: 1; Resistor Type: Thick Film; Termination: SMD/SMT; Number of Terminations: 2; Max Power Dissipation: 100mW; Features: Moisture Resistant,Automotive AEC-Q200,Anti-Sulfur; Series: AC; Construction: Rectangular; Length: 0.063inch; Width: 0.031inch; Height: 0.022inch; Depth: 0.8mm; Military Standard: Not; Lead Free: Lead Free; RoHS Compliant: Yes; ComponentLink1URL: https://datasheet.ciiva.com/5562/pyu-ac-51-rohs-l-2-5562553.pdf?src-supplier=Mouser; ComponentLink1Description: https://datasheet.ciiva.com/5562/pyu-ac-51-rohs-l-2-5562553.pdf?src-supplier=Mouser; Supplier Part Number 1: 1029044
R33 R36 = RC0603JR-07330RL: RES 330 OHM 5% 1/10W 0603; Manufacturer: Yageo; Power Rating: 100mW; Voltage Rating (DC): 50V; Temperature Coefficient: 100ppm/°C; Supplier 1: Arrow Electronics; Manufacturer Part Number: RC0603JR-07330RL; RoHS: Yes; Category: Chip SMD Resistors; Stock 1: 235000; Pricing 1: 5000=0.00240 (USD); Case/Package: 0603; Number of Pins: 2; Case Code (Imperial): 0603; Case Code (Metric): 1608; Size Code: 0603; Min Operating Temperature: -55°C; Max Operating Temperature: 155°C; Resistance: 330R; Tolerance: 5%; Voltage Rating: 50V; Packaging: Tape and Reel; Resistor Type: Thick Film; Resistance Tolerance: 5%; Package Quantity: 5000; Termination: SMD/SMT; Features: Moisture Resistant; Series: RC; Max Power Dissipation: 100mW; Number of Terminations: 2; Construction: Rectangular; Length: 1.6mm; Width: 0.8mm; Height: 0.45mm; Depth: 0.8mm; REACH SVHC: No SVHC; Lead Free: Lead Free; RoHS Compliant: Yes; Military Standard: Not; ComponentLink1URL: https://datasheet.ciiva.com/46395/443971-46395145.pdf?src-supplier=Element14; ComponentLink1Description: https://datasheet.ciiva.com/46395/443971-46395145.pdf?src-supplier=Element14; ComponentLink2URL: https://datasheet.ciiva.com/12558/rc0603-272842-12558685.pdf?src-supplier=Mouser; ComponentLink2Description: https://datasheet.ciiva.com/12558/rc0603-272842-12558685.pdf?src-supplier=Mouser; ComponentLink3URL: https://datasheet.ciiva.com/7746/1868787-7746487.pdf?src-supplier=Element14; ComponentLink3Description: https://datasheet.ciiva.com/7746/1868787-7746487.pdf?src-supplier=Element14; ComponentLink4URL: https://datasheet.ciiva.com/7746/443971-7746488.pdf?src-supplier=Element14; ComponentLink4Description: https://datasheet.ciiva.com/7746/443971-7746488.pdf?src-supplier=Element14; ComponentLink5URL: https://datasheet.ciiva.com/15189/getdatasheetpartid-342831-15189868.pdf?src-supplier=Verical; ComponentLink5Description: https://datasheet.ciiva.com/15189/getdatasheetpartid-342831-15189868.pdf?src-supplier=Verical; Supplier Part Number 1: RC0603JR-07330RL
R35 R40 = RC0603FR-071K5L: RES 1.5K OHM 1% 1/10W 0603; Manufacturer: Yageo; Voltage Rating (DC): 50V; Resistance: 1.5kR; Temperature Coefficient: 100ppm/°C; Power Rating: 100mW; Supplier 1: Digi-Key; Manufacturer Part Number: RC0603FR-071K5L; RoHS: Yes; Category: Chip SMD Resistors; Stock 1: 2978869; Pricing 1: 1=0.10000, 10=0.02300, 100=0.00930, 1000=0.00417, 2500=0.00362 (USD); Case/Package: 0603; Number of Pins: 2; Case Code (Metric): 1608; Case Code (Imperial): 0603; Size Code: 0603; Min Operating Temperature: -55°C; Max Operating Temperature: 155°C; Tolerance: 1%; Packaging: Tape and Reel; Resistor Type: Thick Film; Voltage Rating: 50V; Package Quantity: 1; Number of Terminations: 2; Termination: SMD/SMT; Max Power Dissipation: 100mW; Features: Moisture Resistant; Series: RC; Resistance Tolerance: 1%; Construction: Rectangular; Length: 0.063inch; Width: 0.031inch; Height: 0.022inch; Depth: 0.8mm; REACH SVHC: No SVHC; Lead Free: Lead Free; Military Standard: Not; RoHS Compliant: Yes; Supplier Part Number 1: 311-1.50KHRCT-ND
R37 R38 = RC0603FR-070RL: RES SMD 0R, 1%, 0.1W, 0603; Manufacturer: Yageo; Resistance: 0mR; Power Rating: 100mW; Voltage Rating (DC): 50V; Temperature Coefficient: 200ppm/°C; Current Rating: 1A; Working Voltage: 75V; Supplier 1: Arrow Electronics; Manufacturer Part Number: RC0603FR-070RL; RoHS: Yes; Category: Chip SMD Resistors; Stock 1: 1270000; Pricing 1: 5000=0.00320, 5000=0.00490, 50000=0.00450, 500000=0.00250, 2500000=0.00150 (USD); Case/Package: 0603; Number of Pins: 2; Contact Plating: Tin,Matte; Case Code (Metric): 1608; Case Code (Imperial): 0603; Min Operating Temperature: -55°C; Max Operating Temperature: 155°C; Resistor Type: Thick Film; Packaging: Tape and Reel; Tolerance: 1%; Package Quantity: 5000; Voltage Rating: 50V; Number of Terminations: 2; Termination: SMD/SMT; Max Power Dissipation: 100mW; Features: Moisture Resistant; Length: 1.6mm; Width: 0.031inch; Height: 0.45mm; Depth: 0.8mm; Radiation Hardening: No; REACH SVHC: No SVHC; Lead Free: Lead Free; Military Standard: Not; ComponentLink1URL: https://datasheet.ciiva.com/11808/0900766b80f96399-11808172.pdf?src-supplier=RSComponents; ComponentLink1Description: https://datasheet.ciiva.com/11808/0900766b80f96399-11808172.pdf?src-supplier=RSComponents; ComponentLink2URL: https://datasheet.ciiva.com/5558/rc0603-272842-5558341.pdf?src-supplier=Mouser; ComponentLink2Description: https://datasheet.ciiva.com/5558/rc0603-272842-5558341.pdf?src-supplier=Mouser; ComponentLink3URL: https://datasheet.ciiva.com/46382/443971-46382072.pdf?src-supplier=Element14; ComponentLink3Description: https://datasheet.ciiva.com/46382/443971-46382072.pdf?src-supplier=Element14; ComponentLink4URL: https://datasheet.ciiva.com/29721/pyu-r-int-thick-7-29721178.pdf?src-supplier=Digi-Key; ComponentLink4Description: https://datasheet.ciiva.com/29721/pyu-r-int-thick-7-29721178.pdf?src-supplier=Digi-Key; ComponentLink5URL: https://datasheet.ciiva.com/5684/443971-5684699.pdf?src-supplier=Farnell; ComponentLink5Description: https://datasheet.ciiva.com/5684/443971-5684699.pdf?src-supplier=Farnell; ComponentLink6URL: https://datasheet.ciiva.com/7983/443971-7983627.pdf?src-supplier=Element14; ComponentLink6Description: https://datasheet.ciiva.com/7983/443971-7983627.pdf?src-supplier=Element14; ComponentLink7URL: https://datasheet.ciiva.com/29721/pyu-rc0603-51-rohs-l-4-29721179.pdf?src-supplier=Digi-Key; ComponentLink7Description: https://datasheet.ciiva.com/29721/pyu-rc0603-51-rohs-l-4-29721179.pdf?src-supplier=Digi-Key; ComponentLink8URL: https://datasheet.ciiva.com/22643/1868787-22643388.pdf?src-supplier=Element14; ComponentLink8Description: https://datasheet.ciiva.com/22643/1868787-22643388.pdf?src-supplier=Element14; Supplier Part Number 1: RC0603FR-070RL
R39 R43 = RC0603FR-071KL: as R25 on sheet Heater_Sheet; ComponentLink1URL: https://www.verical.com/server-webapp/html/getDatasheet?partID=409289&src-supplier=Verical; ComponentLink1Description: https://www.verical.com/server-webapp/html/getDatasheet?partID=409289&src-supplier=Verical; Supplier 1: Digi-Key; Manufacturer Part Number: RC0603FR-071KL; Stock 1: 21472395; Pricing 1: 1=0.1, 10=0.023, 100=0.0094, 1000=0.0042, 2500=0.0037 (USD); Case/Package: 0603; Contact Plating: Tin,Matte; Case Code (Imperial): 0603; Case Code (Metric): 1608; Min Operating Temperature: -55°C; Max Operating Temperature: 155°C; Tolerance: 1%; Composition: Thick Film; Packaging: Tape and Reel; Termination: SMD/SMT; Military Standard: Not; Length: 1.6mm; Height: 0.45mm; Depth: 0.8mm; Radiation Hardening: No; REACH SVHC: No SVHC; Lead Free: Lead Free; ComponentLink2URL: http://documents.rs-components.com/techlib://itc_doclist_GB.htm?stockno=5048928&src-supplier=RSComponents; ComponentLink2Description: http://documents.rs-components.com/techlib://itc_doclist_GB.htm?stockno=5048928&src-supplier=RSComponents; ComponentLink3URL: http://www.yageo.com/documents/recent/PYu-RC0603_51_RoHS_L_4.pdf?src-supplier=Avnet+Europe; ComponentLink3Description: http://www.yageo.com/documents/recent/PYu-RC0603_51_RoHS_L_4.pdf?src-supplier=Avnet+Europe; ComponentLink4URL: http://www.farnell.com/datasheets/2167052.pdf?src-supplier=Element14; ComponentLink4Description: http://www.farnell.com/datasheets/2167052.pdf?src-supplier=Element14; ComponentLink5URL: http://www.farnell.com/datasheets/1868787.pdf?src-supplier=Element14; ComponentLink5Description: http://www.farnell.com/datasheets/1868787.pdf?src-supplier=Element14; ComponentLink6URL: http://www.yageo.com/documents/recent/PYu-RC_Group_51_RoHS_L_2.pdf?src-supplier=Avnet; ComponentLink6Description: http://www.yageo.com/documents/recent/PYu-RC_Group_51_RoHS_L_2.pdf?src-supplier=Avnet; ComponentLink7URL: https://www.verical.com/server-webapp/html/getDatasheet?partID=404327&src-supplier=Verical; ComponentLink7Description: https://www.verical.com/server-webapp/html/getDatasheet?partID=404327&src-supplier=Verical; ComponentLink8URL: http://www.farnell.com/datasheets/443971.pdf?src-supplier=Element14; ComponentLink8Description: http://www.farnell.com/datasheets/443971.pdf?src-supplier=Element14; Supplier Part Number 1: 311-1.00KHRDKR-ND
R44 R45 = RC0603FR-074K7L: RES SMD 4.7K OHM 1% 1/10W 0603; Manufacturer: Yageo; Resistance: 4.7kR; Temperature Coefficient: 100ppm/°C; Power Rating: 100mW; Voltage Rating (DC): 50V; Supplier 1: Digi-Key; Manufacturer Part Number: RC0603FR-074K7L; RoHS: Yes; Category: Chip SMD Resistors; Stock 1: 1924316; Pricing 1: 1=0.10000, 10=0.02400, 100=0.00970, 1000=0.00436, 2500=0.00378 (USD); Case/Package: 0603; Number of Pins: 2; Case Code (Imperial): 0603; Case Code (Metric): 1608; Size Code: 0603; Min Operating Temperature: -55°C; Max Operating Temperature: 155°C; Tolerance: 1%; Resistor Type: Thick Film; Packaging: Tape and Reel; Voltage Rating: 50V; Termination: SMD/SMT; Features: Moisture Resistant; Series: RC; Max Power Dissipation: 100mW; Number of Terminations: 2; Construction: Rectangular; Resistance Tolerance: 1%; Length: 1.6mm; Width: 0.8mm; Height: 0.45mm; Depth: 0.8mm; Lead Pitch: 0.3mm; REACH SVHC: No SVHC; Lead Free: Lead Free; RoHS Compliant: Yes; Military Standard: Not; ComponentLink1URL: https://datasheet.ciiva.com/15189/getdatasheetpartid-422754-15189760.pdf?src-supplier=Verical; ComponentLink1Description: https://datasheet.ciiva.com/15189/getdatasheetpartid-422754-15189760.pdf?src-supplier=Verical; ComponentLink2URL: https://datasheet.ciiva.com/22747/443971-22747528.pdf?src-supplier=Element14; ComponentLink2Description: https://datasheet.ciiva.com/22747/443971-22747528.pdf?src-supplier=Element14; ComponentLink3URL: https://datasheet.ciiva.com/7660/38590-7660794.pdf?src-supplier=Element14; ComponentLink3Description: https://datasheet.ciiva.com/7660/38590-7660794.pdf?src-supplier=Element14; ComponentLink4URL: https://datasheet.ciiva.com/7746/1868787-7746365.pdf?src-supplier=Element14; ComponentLink4Description: https://datasheet.ciiva.com/7746/1868787-7746365.pdf?src-supplier=Element14; ComponentLink5URL: https://datasheet.ciiva.com/46440/1868787-46440909.pdf?src-supplier=Element14; ComponentLink5Description: https://datasheet.ciiva.com/46440/1868787-46440909.pdf?src-supplier=Element14; ComponentLink6URL: https://datasheet.ciiva.com/7746/1738695-7746366.pdf?src-supplier=Element14; ComponentLink6Description: https://datasheet.ciiva.com/7746/1738695-7746366.pdf?src-supplier=Element14; Supplier Part Number 1: 311-4.70KHRCT-ND

## Nets that join several sheets
3V3: Regulator_Sheet (C7.1 C8.1 U2.2 U2.4), Controller_Section (12 pins), Connector_Section (6 pins), Switches_Sheet (6 pins)
5V: Regulator_Sheet (C4.1 C5.1 U1.3), Current_Sense_Sheet (6 pins), Connector_Section (6 pins), Temperature_Sensor_Section (14 pins)
CRNT_SNS.IP+_1: Current_Sense_Sheet (7 pins), Gate_Driver_Sheet (P4.1)
CRNT_SNS.IP+_2: Current_Sense_Sheet (7 pins), Gate_Driver_Sheet (P5.1)
GND: Regulator_Sheet (11 pins), Current_Sense_Sheet (22 pins), Battery_Charger_Sheet (7 pins), Controller_Section (16 pins), Connector_Section (23 pins), Switches_Sheet (12 pins), Gate_Driver_Sheet (5 pins), Heater_Sheet (7 pins), Temperature_Sensor_Section (16 pins)
VCC: Regulator_Sheet (C6.1 D1.1 R5.2), Current_Sense_Sheet (U3.3 U3.4 U4.3 U4.4), Battery_Charger_Sheet (5 pins), Controller_Section (R14.1), Connector_Section (SB5.2 SB6.1), Gate_Driver_Sheet (C44.1 U6.6), Heater_Sheet (5 pins)
VIOUT_1: Current_Sense_Sheet (C18.1 R6.1 R8.2), Controller_Section (U5.26)
VIOUT_2: Current_Sense_Sheet (C26.1 R9.1 R11.2), Controller_Section (U5.27)
ENA: Controller_Section (U5.53), Connector_Section (P9.13), Gate_Driver_Sheet (R29.1 U6.1 U6.8)
GATE_DRV.INA_1: Controller_Section (U5.16), Gate_Driver_Sheet (U6.2)
GATE_DRV.INB_1: Controller_Section (U5.15), Gate_Driver_Sheet (U6.4)
IO_A3: Controller_Section (U5.17), Connector_Section (R55.2)
IO_A8: Controller_Section (R13.1 U5.41), Connector_Section (SB3.1)
IO_A9: Controller_Section (U5.42), Temperature_Sensor_Section (P7.4 R33.1)
IO_A10: Controller_Section (U5.43), Temperature_Sensor_Section (P7.3 R32.1)
IO_B7: Battery_Charger_Sheet (R4.1), Controller_Section (U5.59)
IO_B9: Controller_Section (U5.62), Temperature_Sensor_Section (R38.1)
IO_B10: Controller_Section (U5.29), Connector_Section (P12.4)
IO_B11: Controller_Section (U5.30), Connector_Section (P12.6)
IO_B12: Controller_Section (U5.33), Connector_Section (P12.11)
IO_B13: Controller_Section (U5.34), Connector_Section (P12.12)
IO_B14: Controller_Section (U5.35), Connector_Section (P12.13)
IO_B15: Controller_Section (U5.36), Connector_Section (P12.14)
IO_C0: Controller_Section (U5.8), Connector_Section (P9.1)
IO_C1: Controller_Section (U5.9), Connector_Section (P9.2)
IO_C2: Controller_Section (U5.10), Connector_Section (P9.3)
IO_C3: Controller_Section (U5.11), Connector_Section (P9.4)
IO_C4: Controller_Section (U5.24), Connector_Section (P9.5), Temperature_Sensor_Section (R45.1)
IO_C5: Controller_Section (U5.25), Connector_Section (P9.6), Temperature_Sensor_Section (R36.2)
IO_C6: Controller_Section (U5.37), Connector_Section (P9.7)
IO_C7: Controller_Section (U5.38), Connector_Section (P9.8)
IO_C8: Controller_Section (U5.39), Connector_Section (P9.9)
IO_C9: Controller_Section (U5.40), Connector_Section (P9.10), Heater_Sheet (R28.1)
IO_C13: Controller_Section (U5.2), Connector_Section (P9.14), Temperature_Sensor_Section (R44.1)
MISO: Controller_Section (U5.22), Connector_Section (P11.5)
MOSI: Controller_Section (U5.23), Connector_Section (P11.3)
NRST: Controller_Section (C33.1 SW1.3 U5.7), Connector_Section (J1.10)
OSC_IN: Controller_Section (U5.3), Connector_Section (P9.15 P11.7)
OSC_OUT: Controller_Section (U5.4), Connector_Section (P9.16 P11.6)
PWM_D2: Controller_Section (U5.54), Connector_Section (Q15.3 R49.1)
SPI_CLK: Controller_Section (U5.21), Connector_Section (P11.4)
SPI_CS: Controller_Section (U5.20), Connector_Section (P11.8)
SW_1: Controller_Section (U5.55), Switches_Sheet (C35.2 R19.1 SW2.3)
SW_2: Controller_Section (U5.28), Switches_Sheet (C36.2 R20.1 SW3.3)
SW_3: Controller_Section (U5.56), Switches_Sheet (C37.2 R21.1 SW4.3)
SW_4: Controller_Section (U5.57), Switches_Sheet (C38.2 R22.1 SW5.3)
SW_5: Controller_Section (U5.58), Switches_Sheet (C39.2 R23.1 SW7.3)
SW_6: Controller_Section (U5.50), Connector_Section (R58.2), Switches_Sheet (C40.2 R24.1 SW6.3)
SWCLK: Controller_Section (U5.49), Connector_Section (J1.4)
SWDIO: Controller_Section (U5.46), Connector_Section (J1.2)
USART_RX: Controller_Section (U5.52), Connector_Section (P9.12 P13.3)
USART_TX: Controller_Section (U5.51), Connector_Section (P9.11 P13.2)